# Altium schematic sheet 04_OV5640.SchDoc
size A3; SheetNumber: 5; SheetTotal: 6
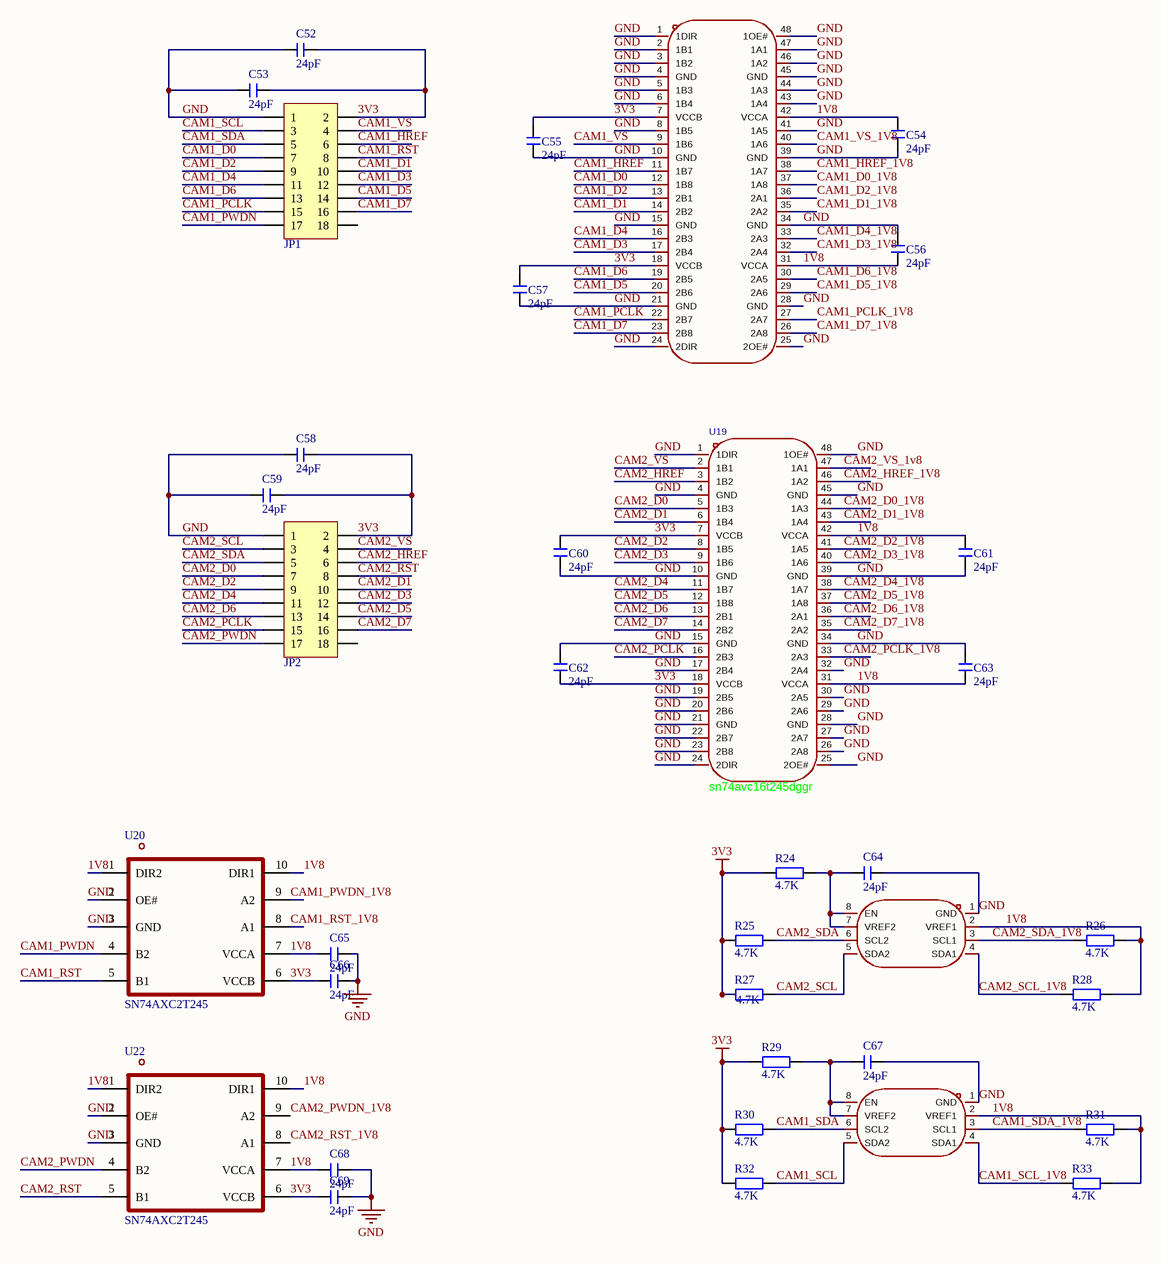
[diagram p0: 04_OV5640.SchDoc]

## Parts
C52  24pF  [C 0603_L]
C53  24pF  [C 0603_L]
C54  24pF  [C 0603_L]
C55  24pF  [C 0603_L]
C56  24pF  [C 0603_L]
C57  24pF  [C 0603_L]
C58  24pF  [C 0603_L]
C59  24pF  [C 0603_L]
C60  24pF  [C 0603_L]
C61  24pF  [C 0603_L]
C62  24pF  [C 0603_L]
C63  24pF  [C 0603_L]
C64  24pF  [C 0603_L]
C65  24pF  [C 0603_L]
C66  24pF  [C 0603_L]
C67  24pF  [C 0603_L]
C68  24pF  [C 0603_L]
C69  24pF  [C 0603_L]
JP1  Header 9X2  [HDR2.54-LI-2x9P]  (value not drawn)
JP2  Header 9X2  [HDR2.54-LI-2x9P]  (value not drawn)
R24  4.7K  [R 0603_L]
R25  4.7K  [R 0603_L]
R26  4.7K  [R 0603_L]
R27  4.7K  [R 0603_L]
R28  4.7K  [R 0603_L]
R29  4.7K  [R 0603_L]
R30  4.7K  [R 0603_L]
R31  4.7K  [R 0603_L]
R32  4.7K  [R 0603_L]
R33  4.7K  [R 0603_L]
U18  sn74avc16t245dggr  [TSSOP-48_L12.6-W6.2-P0.50-LS8.1-BL]  (value not drawn)
U19  sn74avc16t245dggr  [TSSOP-48_L12.6-W6.2-P0.50-LS8.1-BL]
U20  SN74AXC2T245  [SN74AXC2T245]
U21  pca9306dqer  [X2SON-8_L1.4-W1.0-P0.35-BL]  (value not drawn)
U22  SN74AXC2T245  [SN74AXC2T245]
U23  pca9306dqer  [X2SON-8_L1.4-W1.0-P0.35-BL]  (value not drawn)

## Nets
3V3: C52.1 C53.2 C55.1 C57.1 C58.1 C59.2 C60.1 C62.2 C66.1 C69.1 JP1.2 JP2.2 R24.2 R25.2 R27.2 R29.2 R30.2 R32.2 U18.7(VCCB) U18.18(VCCB) U19.7(VCCB) U19.18(VCCB) U20.6(VCCB) U22.6(VCCB)
GND: C52.2 C53.1 C54.2 C55.2 C56.2 C57.2 C58.2 C59.1 C60.2 C61.2 C62.1 C63.2 C64.1 C65.2 C66.2 C67.1 C68.2 C69.2 JP1.1 JP2.1 U18.1(1DIR) U18.2(1B1) U18.3(1B2) U18.4(GND) U18.5(1B3) U18.6(1B4) U18.8(1B5) U18.10(GND) U18.15(GND) U18.21(GND) U18.24(2DIR) U18.25(2OE#) U18.28(GND) U18.34(GND) U18.39(GND) U18.41(1A5) U18.43(1A4) U18.44(1A3) U18.45(GND) U18.46(1A2) U18.47(1A1) U18.48(1OE#) U19.1(1DIR) U19.4(GND) U19.10(GND) U19.15(GND) U19.17(2B4) U19.19(2B5) U19.20(2B6) U19.21(GND) U19.22(2B7) U19.23(2B8) U19.24(2DIR) U19.25(2OE#) U19.26(2A8) U19.27(2A7) U19.28(GND) U19.29(2A6) U19.30(2A5) U19.32(2A4) U19.34(GND) U19.39(GND) U19.45(GND) U19.48(1OE#) U20.2(OE#) U20.3(GND) U21.1(GND) U22.2(OE#) U22.3(GND) U23.1(GND)
1V8: C54.1 C56.1 C61.1 C63.1 C65.1 C68.1 R26.1 R28.1 R31.1 R33.1 U18.31(VCCA) U18.42(VCCA) U19.31(VCCA) U19.42(VCCA) U20.1(DIR2) U20.7(VCCA) U20.10(DIR1) U21.2(VREF1) U22.1(DIR2) U22.7(VCCA) U22.10(DIR1) U23.2(VREF1)
CAM1_D0: JP1.7 U18.12(1B8)
CAM1_D0_1V8: U18.37(1A8)
CAM1_D1: JP1.10 U18.14(2B2)
CAM1_D1_1V8: U18.35(2A2)
CAM1_D2: JP1.9 U18.13(2B1)
CAM1_D2_1V8: U18.36(2A1)
CAM1_D3: JP1.12 U18.17(2B4)
CAM1_D3_1V8: U18.32(2A4)
CAM1_D4: JP1.11 U18.16(2B3)
CAM1_D4_1V8: U18.33(2A3)
CAM1_D5: JP1.14 U18.20(2B6)
CAM1_D5_1V8: U18.29(2A6)
CAM1_D6: JP1.13 U18.19(2B5)
CAM1_D6_1V8: U18.30(2A5)
CAM1_D7: JP1.16 U18.23(2B8)
CAM1_D7_1V8: U18.26(2A8)
CAM1_HREF: JP1.6 U18.11(1B7)
CAM1_HREF_1V8: U18.38(1A7)
CAM1_PCLK: JP1.15 U18.22(2B7)
CAM1_PCLK_1V8: U18.27(2A7)
CAM1_PWDN: JP1.17 U20.4(B2)
CAM1_PWDN_1V8: U20.9(A2)
CAM1_RST: JP1.8 U20.5(B1)
CAM1_RST_1V8: U20.8(A1)
CAM1_SCL: JP1.3 R32.1 U23.5(SDA2)
CAM1_SCL_1V8: R33.2 U23.4(SDA1)
CAM1_SDA: JP1.5 R30.1 U23.6(SCL2)
CAM1_SDA_1V8: R31.2 U23.3(SCL1)
CAM1_VS: JP1.4 U18.9(1B6)
CAM1_VS_1V8: U18.40(1A6)
CAM2_D0: JP2.7 U19.5(1B3)
CAM2_D0_1V8: U19.44(1A3)
CAM2_D1: JP2.10 U19.6(1B4)
CAM2_D1_1V8: U19.43(1A4)
CAM2_D2: JP2.9 U19.8(1B5)
CAM2_D2_1V8: U19.41(1A5)
CAM2_D3: JP2.12 U19.9(1B6)
CAM2_D3_1V8: U19.40(1A6)
CAM2_D4: JP2.11 U19.11(1B7)
CAM2_D4_1V8: U19.38(1A7)
CAM2_D5: JP2.14 U19.12(1B8)
CAM2_D5_1V8: U19.37(1A8)
CAM2_D6: JP2.13 U19.13(2B1)
CAM2_D6_1V8: U19.36(2A1)
CAM2_D7: JP2.16 U19.14(2B2)
CAM2_D7_1V8: U19.35(2A2)
CAM2_HREF: JP2.6 U19.3(1B2)
CAM2_HREF_1V8: U19.46(1A2)
CAM2_PCLK: JP2.15 U19.16(2B3)
CAM2_PCLK_1V8: U19.33(2A3)
CAM2_PWDN: JP2.17 U22.4(B2)
CAM2_PWDN_1V8: U22.9(A2)
CAM2_RST: JP2.8 U22.5(B1)
CAM2_RST_1V8: U22.8(A1)
CAM2_SCL: JP2.3 R27.1 U21.5(SDA2)
CAM2_SCL_1V8: R28.2 U21.4(SDA1)
CAM2_SDA: JP2.5 R25.1 U21.6(SCL2)
CAM2_SDA_1V8: R26.2 U21.3(SCL1)
CAM2_VS: JP2.4 U19.2(1B1)
CAM2_VS_1v8: U19.47(1A1)
NetC64_2: C64.2 R24.1 U21.7(VREF2) U21.8(EN)
NetC67_2: C67.2 R29.1 U23.7(VREF2) U23.8(EN)

Not connected (* = marked no-connect by the designer): JP1 18; JP2 18

## Library data of the parts
C52-C69 = C: 贴片电容; BOM名称: 无极性贴片电容; 淘宝ID: 封装库来自淘宝 ID：黄晶宝石; 联系售后: https://shop463601444.taobao.com
JP1 JP2 = Header 9X2: 9*2P接插件; 版权归属: 源创客; BOM名称: 9*2P接插件; 学习资源: www.ooocke.com
R24-R33 = R: 贴片电阻; 版权归属: 来自淘宝 ID：黄晶宝石; BOM名称: 贴片电阻; 联系售后: https://shop463601444.taobao.com
U18 U19 = sn74avc16t245dggr: SN74AVC16T245 具有可配置电压转换和三态输出的 16 位双电源总线收发器; Manufacturer: TI(德州仪器); AddInBom: yes; ModelId: 3630bc8bc65c4ae4913ce685d85b0283; ModelName: TSSOP-48_L12.6-W6.1-H1.0-LS8.1-P0.50; ModelTransform: 318.898,496.063,0,90,0,0,0,0.0045,0; Symbol: SN74AVC16T245DGGR; LCSC Part Name: 具备可配置电平转换/电压转换功能和三态输出的16位双电源总线收发器; SupplierPart: C148481; ManufacturerPart: SN74AVC16T245DGGR; Supplier Footprint: TSSOP-48-6.2mm; JLCPCB Part Class: Extended Part; Datasheet: https://www.ti.com/cn/lit/gpn/sn74avc16t245; Supplier: LCSC; ConvertToPcb: yes; FootprintName: TSSOP-48_L12.6-W6.2-P0.50-LS8.1-BL
U21 U23 = pca9306dqer: 数据速率:-;工作电压(VCCA):-;工作电压(VCCB):-;元件数:-;每个电路通道数:2;; Manufacturer: TI(德州仪器); AddInBom: yes; ModelId: ca9e004a924f4dd0ba6981db82d16128; ModelName: X2SON-8_L1.4-W1.0-H0.4-P0.35-BL; ModelTransform: 55.118,40.05354,0,180,0,0,0.003,0.603,0; Channel Type: 双向; Number of Circuits: 2; Output Type: 开漏; Symbol: PCA9306DQER; LCSC Part Name: 双路双向I²C总线和SMBus电压电平转换器; SupplierPart: C440032; ManufacturerPart: PCA9306DQER; Supplier Footprint: X2-SON-8(0.8x1.4); JLCPCB Part Class: Extended Part; Datasheet: https://www.ti.com/cn/lit/gpn/pca9306; Supplier: LCSC; ConvertToPcb: yes; FootprintName: X2SON-8_L1.4-W1.0-P0.35-BL; Input Signal: -; Output Signal: -; Data Rate: -; Voltage - Supply(VCCA): -; Voltage - Supply(VCCB): -; Number of Elements: -; Operating Temperature: -40℃~+85℃; Features: -